# Altium schematic sheet BATT.SchDoc: Battery Terminal Connection
size A4; ApprovedBy: LD Stanton; Author: LD Stanton; CompanyName: University of Cape Town; DrawnBy: Lawrence Stanton; Engineer: Lawrence Stanton; Organization: University of Cape Town; Address1: Department of Electrical Engineering; Address2: Rondebosch; Address3: Cape Town; Address4: South Africa 7701; DocumentNumber: 2; SheetNumber: 2; SheetTotal: 14
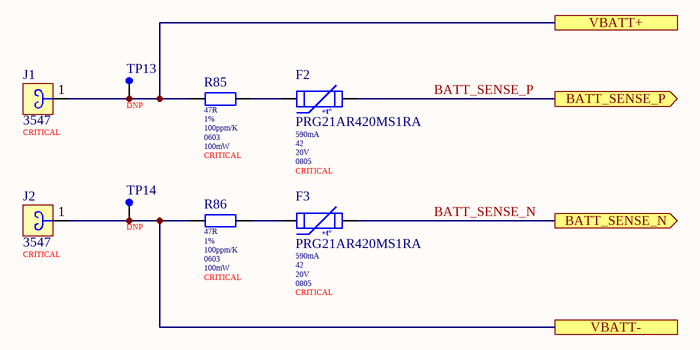
[diagram p0: BATT.SchDoc]

## Parts
F2  PRG21AR420MS1RA  Current: 590mA  Resistance: 42  Voltage: 20V  Package: 0805  Placement: CRITICAL  [0805 Fuse (PRG21AR420MS1RA) MRG B]
F3  PRG21AR420MS1RA  Current: 590mA  Resistance: 42  Voltage: 20V  Package: 0805  Placement: CRITICAL  [0805 Fuse (PRG21AR420MS1RA) MRG B]
J1  3547  Placement: CRITICAL  [3547]
J2  3547  Placement: CRITICAL  [3547]
R85  value 47R  Tolerance: 1%  Temperature Coefficient: 100ppm/K  Package: 0603  Power: 100mW  Populate: CRITICAL  [0603 (Uniroyal) B]  (hidden comment: 0603WAF470JT5E)
R86  value 47R  Tolerance: 1%  Temperature Coefficient: 100ppm/K  Package: 0603  Power: 100mW  Populate: CRITICAL  [0603 (Uniroyal) B]  (hidden comment: 0603WAF470JT5E)
TP13  Placement: DNP  [Test Point Keystone 5000]  (hidden comment: 5000)
TP14  Placement: DNP  [Test Point Keystone 5001]  (hidden comment: 5001)

## Ports
BATT_SENSE_N (out), BATT_SENSE_P (out), VBATT+, VBATT-

## Nets
BATT_SENSE_N: F3.2 ; port BATT_SENSE_N
BATT_SENSE_P: F2.2 ; port BATT_SENSE_P
VBATT+: J1.1 R85.1 TP13.1 ; port VBATT+
VBATT-: J2.1 R86.1 TP14.1 ; port VBATT-
NetF2_1: F2.1 R85.2
NetF3_1: F3.1 R86.2

## Notes on the sheet
- Size:
- Date:
- A4
- Number:
- Time:
- Revision:
- Sheet
- of
- File:
- Author:
- (in symbol CMP-00144-1) +t°

## Library data of the parts
F2 F3 = CMP-00144-1: Thermistor PTC 42 Ohm 20% 2-Pin 0805 Surface Mount Solder Pad T/R Automotive; ComponentLink1URL: https://jlcpcb.com/api/file/downloadByFileSystemAccessId/8588911221270073344; Max Operating Temperature: 105°C; Min Operating Temperature: -40°C; ComponentLink1Description: Datasheet; LCSC Part Number: C341812
J1 J2 = CMP-00119-1: Female PCB Terminal 6.4x0.81mm Tabs; pin to pad: 1>1A+1B; ComponentLink2Description: Drawing; ComponentLink1Description: Product Page; ComponentLink2URL: https://www.keyelco.com/product-pdf.cfm?p=681; ComponentLink3Description: Catalogue; LCSC Part Number: C3029552; ComponentLink3URL: https://www.keyelco.com/userAssets/file/M65p61.pdf; ComponentLink1URL: https://www.keyelco.com/product.cfm/Horizontal-Entry/3547/product_id/681
R85 R86 = CMP-00128-3: Resistor 47R 0603 ±1% Thick Film Uniroyal; Voltage Rating: 75V; ComponentLink1Description: Datasheet; Min Operating Temperature: -55°C; Manufacturer: Uniroyal; ComponentLink1URL: https://datasheet.lcsc.com/szlcsc/1811062009_UNI-ROYAL-Uniroyal-Elec-0603WAF1002T5E_C25804.pdf; Composition: Thick Film; LCSC Part Number: C23182; Max Operating Temperature: 155°C
TP13 = CMP-00140-2: Keystone Test Point Insulated Ring Red; LCSC Part Number: C5199900
TP14 = CMP-00028-00009-2: Keystone Test Point Insulated Ring Black; LCSC Part Number: C238122